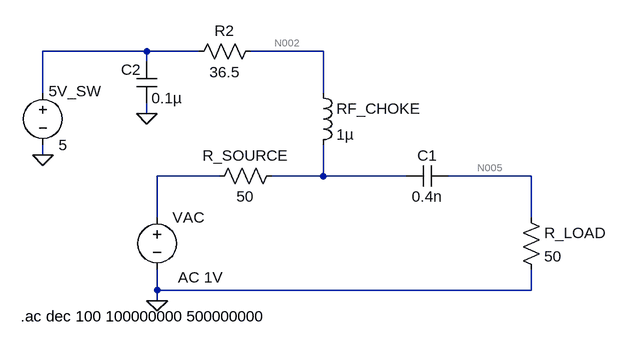
[diagram p0: schematic bias_tee_circuit.asc]
bias_tee_circuit.asc, the LTspice schematic file:
Version 4
SHEET 1 880 680
WIRE 16 -48 -144 -48
WIRE 96 -48 16 -48
WIRE 288 -48 176 -48
WIRE 16 -32 16 -48
WIRE -144 16 -144 -48
WIRE 288 16 288 -48
WIRE 16 48 16 32
WIRE -144 112 -144 96
WIRE 128 144 32 144
WIRE 288 144 288 96
WIRE 288 144 208 144
WIRE 416 144 288 144
WIRE 608 144 480 144
WIRE 32 208 32 144
WIRE 608 208 608 144
WIRE 32 320 32 288
WIRE 608 320 608 288
WIRE 608 320 32 320
WIRE 32 336 32 320
FLAG -144 112 0
FLAG 32 336 0
FLAG 16 48 0
SYMBOL voltage 32 192 R0
WINDOW 3 34 85 Left 2
WINDOW 123 32 108 Left 2
WINDOW 39 0 0 Left 0
SYMATTR InstName VAC
SYMATTR Value ""
SYMATTR Value2 AC 1V
SYMBOL voltage -144 0 R0
WINDOW 0 9 13 Left 2
WINDOW 123 0 0 Left 0
WINDOW 39 0 0 Left 0
SYMATTR InstName 5V_SW
SYMATTR Value 5
SYMBOL res 592 192 R0
SYMATTR InstName R_LOAD
SYMATTR Value 50
SYMBOL res 192 -64 R90
WINDOW 0 0 56 VBottom 2
WINDOW 3 32 56 VTop 2
SYMATTR InstName R2
SYMATTR Value 36.5
SYMBOL cap 480 128 R90
WINDOW 0 0 32 VBottom 2
WINDOW 3 32 32 VTop 2
SYMATTR InstName C1
SYMATTR Value 0.4n
SYMBOL ind 272 0 R0
SYMATTR InstName RF_CHOKE
SYMATTR Value 1µ
SYMBOL cap 32 32 R180
WINDOW 0 25 52 Left 2
WINDOW 3 -39 8 Left 2
SYMATTR InstName C2
SYMATTR Value 0.1µ
SYMBOL res 224 128 R90
WINDOW 0 0 56 VBottom 2
WINDOW 3 32 56 VTop 2
SYMATTR InstName R_SOURCE
SYMATTR Value 50
TEXT -178 360 Left 2 !.ac dec 100 100000000 500000000

The netlist it stands for:
* bias_tee_circuit.asc
VAC N003 0 AC 1V
V§5V_SW N001 0 5
R_LOAD N005 0 50
R2 N002 N001 36.5
C1 N005 N004 0.4n
L§RF_CHOKE N002 N004 1µ
C2 0 N001 0.1µ
R_SOURCE N004 N003 50
.ac dec 100 100000000 500000000
.backanno
.end

* Results of the author's LTspice run, read from the files saved beside the schematic
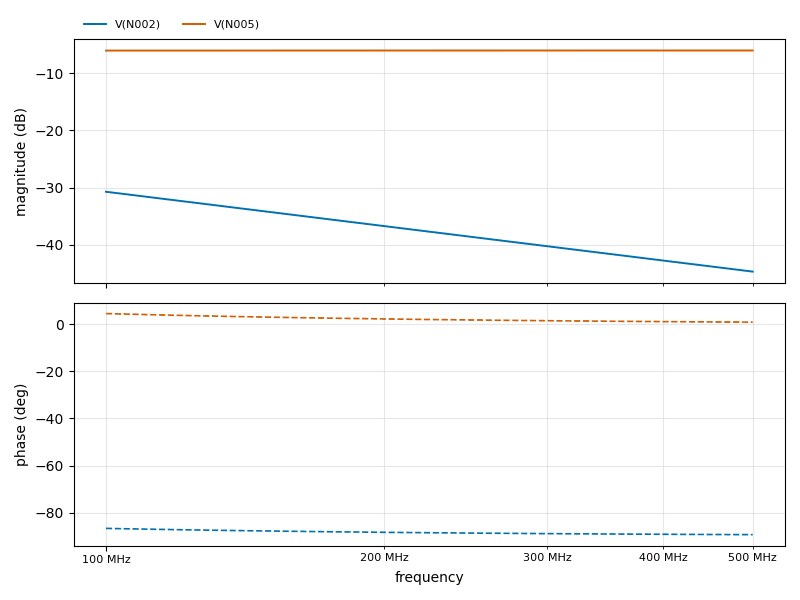
[diagram p1: AC Analysis of bias_tee_circuit.asc, plotted from the saved traces]
* AC Analysis, 1 run:
*   V(N002): -30.75 dB at 100 MHz, -44.72 dB at 500 MHz, peak -30.75 dB at 100 MHz, 3 dB below the peak at 141.5 MHz
*   V(N005): -6.04 dB at 100 MHz, -6.02 dB at 500 MHz, peak -6.02 dB at 500 MHz